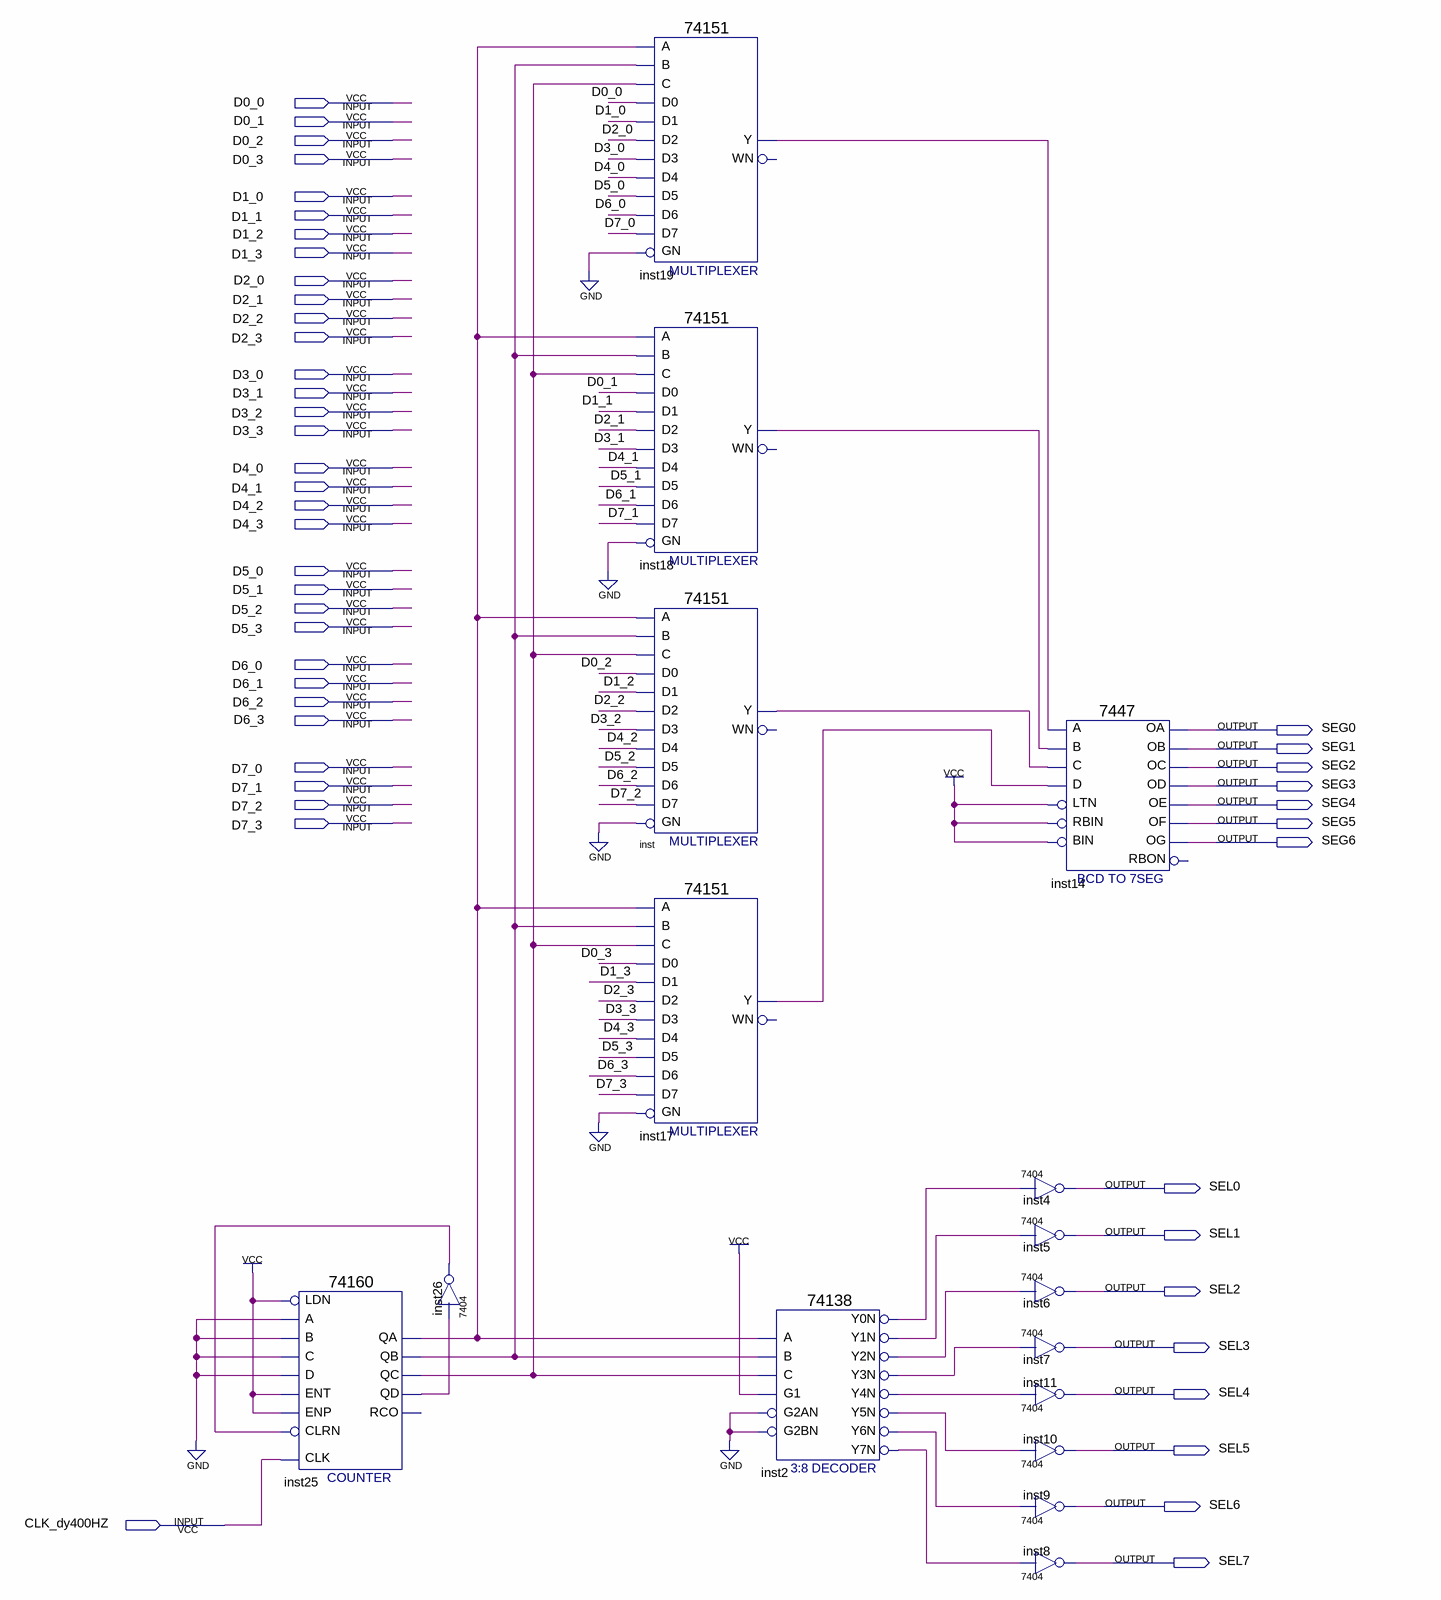
[diagram p0: schematic sheet]
// Quartus schematic DISP_8bit.bdf as structural Verilog: 16 symbols, 48 pins
module DISP_8bit (
  input  D0_0,
  input  D0_1,
  input  D0_2,
  input  D0_3,
  input  D1_0,
  input  D1_1,
  input  D1_2,
  input  D1_3,
  input  D2_0,
  input  D2_1,
  input  D2_2,
  input  D2_3,
  input  D3_0,
  input  D3_1,
  input  D3_2,
  input  D3_3,
  input  D4_0,
  input  D4_1,
  input  D4_2,
  input  D4_3,
  input  D5_0,
  input  D5_1,
  input  D5_2,
  input  D5_3,
  input  D6_0,
  input  D6_1,
  input  D6_2,
  input  D6_3,
  input  D7_0,
  input  D7_1,
  input  D7_2,
  input  D7_3,
  input  CLK_dy400HZ,
  output SEG0,
  output SEG1,
  output SEG2,
  output SEG3,
  output SEG4,
  output SEG5,
  output SEG6,
  output SEL0,
  output SEL1,
  output SEL2,
  output SEL3,
  output SEL4,
  output SEL5,
  output SEL6,
  output SEL7
);

  wire inst2_y0n, inst2_y1n, inst2_y2n, inst2_y3n, inst2_y4n, inst2_y5n, inst2_y6n, inst2_y7n, inst17_y,
       inst18_y, inst19_y, inst25_qa, inst25_qb, inst25_qc, inst25_qd, inst26_1, inst_y;

  \74160  inst25 (
    .CLK(CLK_dy400HZ), .ENT(1'b1), .A(1'b0), .B(1'b0), .C(1'b0), .D(1'b0), .LDN(1'b1), .ENP(1'b1),
    .CLRN(inst26_1), .QD(inst25_qd), .QA(inst25_qa), .QB(inst25_qb), .QC(inst25_qc));  // open: RCO
  \7404  inst26 (.\2 (inst25_qd), .\1 (inst26_1));
  \74151  inst19 (
    .GN(1'b0), .C(inst25_qc), .B(inst25_qb), .A(inst25_qa), .D5(D5_0), .D0(D0_0), .D1(D1_0), .D4(D4_0),
    .D3(D3_0), .D2(D2_0), .D6(D6_0), .D7(D7_0), .Y(inst19_y));  // open: WN
  \74151  inst18 (
    .GN(1'b0), .C(inst25_qc), .B(inst25_qb), .A(inst25_qa), .D5(D5_1), .D0(D0_1), .D1(D1_1), .D4(D4_1),
    .D3(D3_1), .D2(D2_1), .D6(D6_1), .D7(D7_1), .Y(inst18_y));  // open: WN
  \74151  inst (
    .GN(1'b0), .C(inst25_qc), .B(inst25_qb), .A(inst25_qa), .D5(D5_2), .D0(D0_2), .D1(D1_2), .D4(D4_2),
    .D3(D3_2), .D2(D2_2), .D6(D6_2), .D7(D7_2), .Y(inst_y));  // open: WN
  \74151  inst17 (
    .GN(1'b0), .C(inst25_qc), .B(inst25_qb), .A(inst25_qa), .D5(D5_3), .D0(D0_3), .D1(D1_3), .D4(D4_3),
    .D3(D3_3), .D2(D2_3), .D6(D6_3), .D7(D7_3), .Y(inst17_y));  // open: WN
  \74138  inst2 (
    .A(inst25_qa), .B(inst25_qb), .G1(1'b1), .C(inst25_qc), .G2AN(1'b0), .G2BN(1'b0), .Y0N(inst2_y0n),
    .Y1N(inst2_y1n), .Y2N(inst2_y2n), .Y3N(inst2_y3n), .Y4N(inst2_y4n), .Y5N(inst2_y5n), .Y6N(inst2_y6n),
    .Y7N(inst2_y7n));
  \7447  inst14 (
    .LTN(1'b1), .B(inst18_y), .C(inst_y), .D(inst17_y), .RBIN(1'b1), .BIN(1'b1), .A(inst19_y), .OB(SEG1),
    .OC(SEG2), .OE(SEG4), .OD(SEG3), .OF(SEG5), .OG(SEG6), .OA(SEG0));  // open: RBON
  \7404  inst4 (.\2 (inst2_y0n), .\1 (SEL0));
  \7404  inst5 (.\2 (inst2_y1n), .\1 (SEL1));
  \7404  inst6 (.\2 (inst2_y2n), .\1 (SEL2));
  \7404  inst7 (.\2 (inst2_y3n), .\1 (SEL3));
  \7404  inst11 (.\2 (inst2_y4n), .\1 (SEL4));
  \7404  inst10 (.\2 (inst2_y5n), .\1 (SEL5));
  \7404  inst9 (.\2 (inst2_y6n), .\1 (SEL6));
  \7404  inst8 (.\2 (inst2_y7n), .\1 (SEL7));
endmodule
